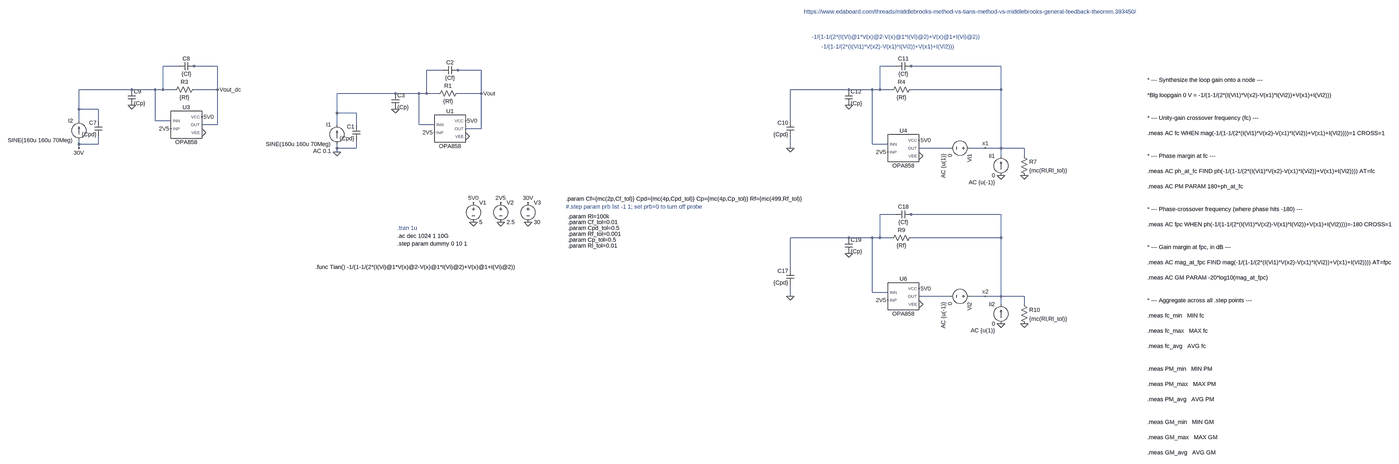
[diagram p0: schematic TIA.asc, whole sheet]
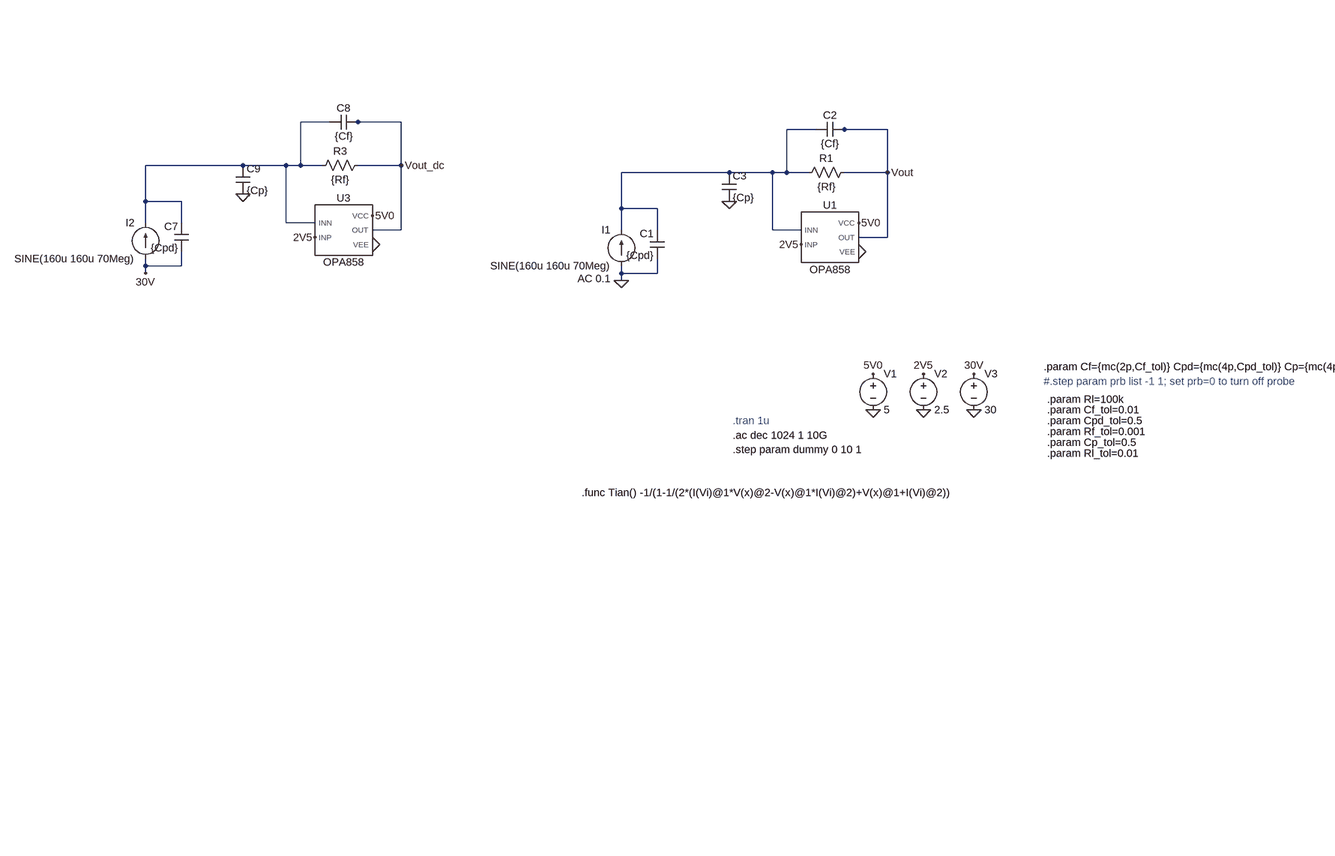
[diagram p1: schematic TIA.asc, part, row 1 of 1, column 1 of 2]
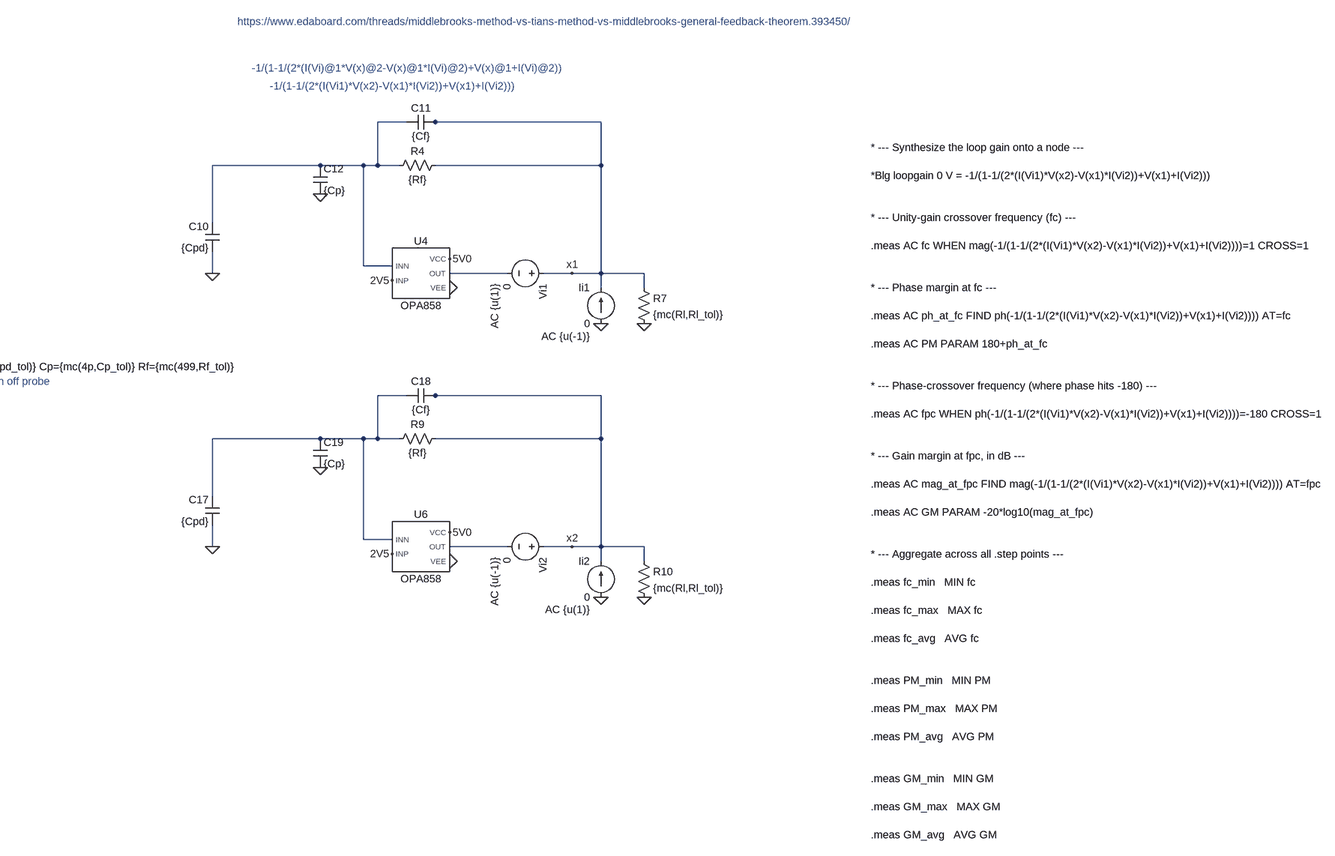
[diagram p2: schematic TIA.asc, part, row 1 of 1, column 2 of 2]
TIA.asc, the LTspice schematic file:
Version 4.1
SHEET 1 5184 1348
WIRE -848 -96 -912 -96
WIRE -784 -96 -800 -96
WIRE -688 -96 -784 -96
WIRE 2256 -96 2192 -96
WIRE 2320 -96 2304 -96
WIRE 2688 -96 2320 -96
WIRE 240 -80 176 -80
WIRE 304 -80 288 -80
WIRE 400 -80 304 -80
WIRE -1040 0 -1280 0
WIRE -944 0 -1040 0
WIRE -912 0 -912 -96
WIRE -912 0 -944 0
WIRE -864 0 -912 0
WIRE -688 0 -688 -96
WIRE -688 0 -784 0
WIRE 2064 0 1824 0
WIRE 2160 0 2064 0
WIRE 2192 0 2192 -96
WIRE 2192 0 2160 0
WIRE 2240 0 2192 0
WIRE 2688 0 2688 -96
WIRE 2688 0 2320 0
WIRE 48 16 -192 16
WIRE 144 16 48 16
WIRE 176 16 176 -80
WIRE 176 16 144 16
WIRE 224 16 176 16
WIRE 400 16 400 -80
WIRE 400 16 304 16
WIRE -1280 80 -1280 0
WIRE -1200 80 -1280 80
WIRE -192 96 -192 16
WIRE -112 96 -192 96
WIRE -1280 128 -1280 80
WIRE -1200 128 -1200 80
WIRE -944 128 -944 0
WIRE -880 128 -944 128
WIRE 1824 128 1824 0
WIRE -688 144 -688 0
WIRE -688 144 -752 144
WIRE -192 144 -192 96
WIRE -112 144 -112 96
WIRE 144 144 144 16
WIRE 208 144 144 144
WIRE 400 160 400 16
WIRE 400 160 336 160
WIRE -1280 224 -1280 208
WIRE -1200 224 -1200 192
WIRE -1200 224 -1280 224
WIRE 2160 224 2160 0
WIRE 2224 224 2160 224
WIRE -1280 240 -1280 224
WIRE -192 240 -192 224
WIRE -112 240 -112 208
WIRE -112 240 -192 240
WIRE 1824 240 1824 192
WIRE 2480 240 2352 240
WIRE 2624 240 2560 240
WIRE 2688 240 2688 0
WIRE 2688 240 2624 240
WIRE 2784 240 2688 240
WIRE -192 256 -192 240
WIRE 2688 272 2688 240
WIRE 2784 272 2784 240
WIRE 2256 512 2192 512
WIRE 2320 512 2304 512
WIRE 2688 512 2320 512
WIRE 2064 608 1824 608
WIRE 2160 608 2064 608
WIRE 2192 608 2192 512
WIRE 2192 608 2160 608
WIRE 2240 608 2192 608
WIRE 2688 608 2688 512
WIRE 2688 608 2320 608
WIRE 1824 736 1824 608
WIRE 2160 832 2160 608
WIRE 2224 832 2160 832
WIRE 1824 848 1824 800
WIRE 2480 848 2352 848
WIRE 2624 848 2560 848
WIRE 2688 848 2688 608
WIRE 2688 848 2624 848
WIRE 2784 848 2688 848
WIRE 2688 880 2688 848
WIRE 2784 880 2784 848
FLAG 368 544 0
FLAG 336 192 0
FLAG 336 128 5V0
FLAG 368 464 5V0
FLAG 480 544 0
FLAG 592 544 0
FLAG 400 16 Vout
FLAG 48 80 0
FLAG 208 176 2V5
FLAG 480 464 2V5
FLAG 592 464 30V
FLAG -752 176 0
FLAG -752 112 5V0
FLAG -688 0 Vout_dc
FLAG -1040 64 0
FLAG -880 160 2V5
FLAG -1280 240 30V
FLAG -192 256 0
FLAG 2352 272 0
FLAG 2352 208 5V0
FLAG 2064 64 0
FLAG 2224 256 2V5
FLAG 1824 240 0
FLAG 2624 240 x1
FLAG 2784 352 0
FLAG 2352 880 0
FLAG 2352 816 5V0
FLAG 2064 672 0
FLAG 2224 864 2V5
FLAG 1824 848 0
FLAG 2624 848 x2
FLAG 2784 960 0
FLAG 2688 352 0
FLAG 2688 960 0
SYMBOL OPA858 272 160 R0
SYMATTR InstName U1
SYMBOL voltage 368 448 R0
WINDOW 123 0 0 Left 0
WINDOW 39 0 0 Left 0
SYMATTR InstName V1
SYMATTR Value 5
SYMBOL voltage 480 448 R0
WINDOW 123 0 0 Left 0
WINDOW 39 0 0 Left 0
SYMATTR InstName V2
SYMATTR Value 2.5
SYMBOL voltage 592 448 R0
WINDOW 123 0 0 Left 0
WINDOW 39 0 0 Left 0
SYMATTR InstName V3
SYMATTR Value 30
SYMBOL res 320 0 R90
WINDOW 0 0 56 VBottom 2
WINDOW 3 32 56 VTop 2
SYMATTR InstName R1
SYMATTR Value {Rf}
SYMBOL current -192 224 R180
WINDOW 0 24 80 Left 2
WINDOW 3 24 0 Left 2
WINDOW 123 24 -28 Left 2
WINDOW 39 0 0 Left 0
SYMATTR InstName I1
SYMATTR Value SINE(160u 160u 70Meg)
SYMATTR Value2 AC 0.1
SYMBOL cap -96 208 R180
WINDOW 0 24 56 Left 2
WINDOW 3 24 8 Left 2
SYMATTR InstName C1
SYMATTR Value {Cpd}
SYMBOL cap 304 -96 R90
WINDOW 0 0 32 VBottom 2
WINDOW 3 32 32 VTop 2
SYMATTR InstName C2
SYMATTR Value {Cf}
SYMBOL cap 32 16 R0
SYMATTR InstName C3
SYMATTR Value {Cp}
SYMBOL OPA858 -816 144 R0
SYMATTR InstName U3
SYMBOL res -768 -16 R90
WINDOW 0 0 56 VBottom 2
WINDOW 3 32 56 VTop 2
SYMATTR InstName R3
SYMATTR Value {Rf}
SYMBOL current -1280 208 R180
WINDOW 0 24 80 Left 2
WINDOW 3 24 0 Left 2
WINDOW 123 24 -28 Left 2
WINDOW 39 0 0 Left 0
SYMATTR InstName I2
SYMATTR Value SINE(160u 160u 70Meg)
SYMBOL cap -1184 192 R180
WINDOW 0 24 56 Left 2
WINDOW 3 24 8 Left 2
SYMATTR InstName C7
SYMATTR Value {Cpd}
SYMBOL cap -784 -112 R90
WINDOW 0 0 32 VBottom 2
WINDOW 3 32 32 VTop 2
SYMATTR InstName C8
SYMATTR Value {Cf}
SYMBOL cap -1056 0 R0
SYMATTR InstName C9
SYMATTR Value {Cp}
SYMBOL OPA858 2288 240 R0
SYMATTR InstName U4
SYMBOL res 2336 -16 R90
WINDOW 0 0 56 VBottom 2
WINDOW 3 32 56 VTop 2
SYMATTR InstName R4
SYMATTR Value {Rf}
SYMBOL cap 1840 192 R180
WINDOW 0 24 56 Left 2
WINDOW 3 24 8 Left 2
SYMATTR InstName C10
SYMATTR Value {Cpd}
SYMBOL cap 2320 -112 R90
WINDOW 0 0 32 VBottom 2
WINDOW 3 32 32 VTop 2
SYMATTR InstName C11
SYMATTR Value {Cf}
SYMBOL cap 2048 0 R0
SYMATTR InstName C12
SYMATTR Value {Cp}
SYMBOL voltage 2576 240 R90
WINDOW 123 24 124 Left 2
WINDOW 39 0 0 Left 0
SYMATTR Value2 AC {u(1)}
SYMATTR InstName Vi1
SYMATTR Value 0
SYMBOL current 2688 352 R180
WINDOW 0 24 80 Left 2
WINDOW 3 24 0 Left 2
WINDOW 123 24 -28 Left 2
WINDOW 39 0 0 Left 0
SYMATTR InstName Ii1
SYMATTR Value 0
SYMATTR Value2 AC {u(-1)}
SYMBOL res 2768 256 R0
SYMATTR InstName R7
SYMATTR Value {mc(Rl,Rl_tol)}
SYMBOL OPA858 2288 848 R0
SYMATTR InstName U6
SYMBOL res 2336 592 R90
WINDOW 0 0 56 VBottom 2
WINDOW 3 32 56 VTop 2
SYMATTR InstName R9
SYMATTR Value {Rf}
SYMBOL cap 1840 800 R180
WINDOW 0 24 56 Left 2
WINDOW 3 24 8 Left 2
SYMATTR InstName C17
SYMATTR Value {Cpd}
SYMBOL cap 2320 496 R90
WINDOW 0 0 32 VBottom 2
WINDOW 3 32 32 VTop 2
SYMATTR InstName C18
SYMATTR Value {Cf}
SYMBOL cap 2048 608 R0
SYMATTR InstName C19
SYMATTR Value {Cp}
SYMBOL voltage 2576 848 R90
WINDOW 123 24 124 Left 2
WINDOW 39 0 0 Left 0
SYMATTR Value2 AC {u(-1)}
SYMATTR InstName Vi2
SYMATTR Value 0
SYMBOL current 2688 960 R180
WINDOW 0 24 80 Left 2
WINDOW 3 24 0 Left 2
WINDOW 123 24 -28 Left 2
WINDOW 39 0 0 Left 0
SYMATTR InstName Ii2
SYMATTR Value 0
SYMATTR Value2 AC {u(1)}
SYMBOL res 2768 864 R0
SYMATTR InstName R10
SYMATTR Value {mc(Rl,Rl_tol)}
TEXT 56 568 Left 2 ;.tran 1u
TEXT 56 600 Left 2 !.ac dec 1024 1 10G
TEXT 904 448 Left 2 !.param Cf={mc(2p,Cf_tol)} Cpd={mc(4p,Cpd_tol)} Cp={mc(4p,Cp_tol)} Rf={mc(499,Rf_tol)}
TEXT 904 480 Left 2 ;#.step param prb list -1 1; set prb=0 to turn off probe
TEXT -280 728 Left 2 !.func Tian() -1/(1-1/(2*(I(Vi)@1*V(x)@2-V(x)@1*I(Vi)@2)+V(x)@1+I(Vi)@2))
TEXT 1880 -320 Left 2 ;https://www.edaboard.com/threads/middlebrooks-method-vs-tians-method-vs-middlebrooks-general-feedback-theorem.393450/
TEXT 1912 -216 Left 2 ;-1/(1-1/(2*(I(Vi)@1*V(x)@2-V(x)@1*I(Vi)@2)+V(x)@1+I(Vi)@2))
TEXT 56 632 Left 2 !.step param dummy 0 10 1
TEXT 912 544 Left 2 !.param Cf_tol=0.01
TEXT 912 568 Left 2 !.param Cpd_tol=0.5
TEXT 912 592 Left 2 !.param Rf_tol=0.001
TEXT 912 616 Left 2 !.param Cp_tol=0.5
TEXT 912 520 Left 2 !.param Rl=100k
TEXT 912 640 Left 2 !.param Rl_tol=0.01
TEXT 1952 -176 Left 2 ;-1/(1-1/(2*(I(Vi1)*V(x2)-V(x1)*I(Vi2))+V(x1)+I(Vi2)))
TEXT 3288 -40 Left 2 !* --- Synthesize the loop gain onto a node ---\n \n*Blg loopgain 0 V = -1/(1-1/(2*(I(Vi1)*V(x2)-V(x1)*I(Vi2))+V(x1)+I(Vi2)))\n \n \n* --- Unity-gain crossover frequency (fc) ---\n \n.meas AC fc WHEN mag(-1/(1-1/(2*(I(Vi1)*V(x2)-V(x1)*I(Vi2))+V(x1)+I(Vi2))))=1 CROSS=1\n \n \n* --- Phase margin at fc ---\n \n.meas AC ph_at_fc FIND ph(-1/(1-1/(2*(I(Vi1)*V(x2)-V(x1)*I(Vi2))+V(x1)+I(Vi2)))) AT=fc\n \n.meas AC PM PARAM 180+ph_at_fc\n \n \n* --- Phase-crossover frequency (where phase hits -180) ---\n \n.meas AC fpc WHEN ph(-1/(1-1/(2*(I(Vi1)*V(x2)-V(x1)*I(Vi2))+V(x1)+I(Vi2))))=-180 CROSS=1\n \n \n* --- Gain margin at fpc, in dB ---\n \n.meas AC mag_at_fpc FIND mag(-1/(1-1/(2*(I(Vi1)*V(x2)-V(x1)*I(Vi2))+V(x1)+I(Vi2)))) AT=fpc\n \n.meas AC GM PARAM -20*log10(mag_at_fpc)\n \n \n* --- Aggregate across all .step points ---\n \n.meas fc_min   MIN fc\n \n.meas fc_max   MAX fc\n \n.meas fc_avg   AVG fc\n \n \n.meas PM_min   MIN PM\n \n.meas PM_max   MAX PM\n \n.meas PM_avg   AVG PM\n \n \n.meas GM_min   MIN GM\n \n.meas GM_max   MAX GM\n \n.meas GM_avg   AVG GM

The netlist it stands for:
* TIA.asc
X§U1 2V5 N003 5V0 0 Vout OPA858  ; pins INP INN VCC VEE OUT
V1 5V0 0 5
V2 2V5 0 2.5
V3 30V 0 30
R1 Vout N003 {Rf}
I1 0 N003 SINE(160u 160u 70Meg) AC 0.1
C1 0 N003 {Cpd}
C2 Vout N003 {Cf}
C3 N003 0 {Cp}
X§U3 2V5 N001 5V0 0 Vout_dc OPA858  ; pins INP INN VCC VEE OUT
R3 Vout_dc N001 {Rf}
I2 30V N001 SINE(160u 160u 70Meg)
C7 30V N001 {Cpd}
C8 Vout_dc N001 {Cf}
C9 N001 0 {Cp}
X§U4 2V5 N002 5V0 0 N004 OPA858  ; pins INP INN VCC VEE OUT
R4 x1 N002 {Rf}
C10 0 N002 {Cpd}
C11 x1 N002 {Cf}
C12 N002 0 {Cp}
Vi1 x1 N004 0 AC {u(1)}
Ii1 0 x1 0 AC {u(-1)}
R7 x1 0 {mc(Rl,Rl_tol)}
X§U6 2V5 N005 5V0 0 N006 OPA858  ; pins INP INN VCC VEE OUT
R9 x2 N005 {Rf}
C17 0 N005 {Cpd}
C18 x2 N005 {Cf}
C19 N005 0 {Cp}
Vi2 x2 N006 0 AC {u(-1)}
Ii2 0 x2 0 AC {u(1)}
R10 x2 0 {mc(Rl,Rl_tol)}
* .tran 1u
.ac dec 1024 1 10G
.param Cf={mc(2p,Cf_tol)} Cpd={mc(4p,Cpd_tol)} Cp={mc(4p,Cp_tol)} Rf={mc(499,Rf_tol)}
* #.step param prb list -1 1; set prb=0 to turn off probe
.func Tian() -1/(1-1/(2*(I(Vi)@1*V(x)@2-V(x)@1*I(Vi)@2)+V(x)@1+I(Vi)@2))
* https://www.edaboard.com/threads/middlebrooks-method-vs-tians-method-vs-middlebrooks-general-feedback-theorem.393450/
* -1/(1-1/(2*(I(Vi)@1*V(x)@2-V(x)@1*I(Vi)@2)+V(x)@1+I(Vi)@2))
.step param dummy 0 10 1
.param Cf_tol=0.01
.param Cpd_tol=0.5
.param Rf_tol=0.001
.param Cp_tol=0.5
.param Rl=100k
.param Rl_tol=0.01
* -1/(1-1/(2*(I(Vi1)*V(x2)-V(x1)*I(Vi2))+V(x1)+I(Vi2)))
* --- Synthesize the loop gain onto a node ---
*Blg loopgain 0 V = -1/(1-1/(2*(I(Vi1)*V(x2)-V(x1)*I(Vi2))+V(x1)+I(Vi2)))
* --- Unity-gain crossover frequency (fc) ---
.meas AC fc WHEN mag(-1/(1-1/(2*(I(Vi1)*V(x2)-V(x1)*I(Vi2))+V(x1)+I(Vi2))))=1 CROSS=1
* --- Phase margin at fc ---
.meas AC ph_at_fc FIND ph(-1/(1-1/(2*(I(Vi1)*V(x2)-V(x1)*I(Vi2))+V(x1)+I(Vi2)))) AT=fc
.meas AC PM PARAM 180+ph_at_fc
* --- Phase-crossover frequency (where phase hits -180) ---
.meas AC fpc WHEN ph(-1/(1-1/(2*(I(Vi1)*V(x2)-V(x1)*I(Vi2))+V(x1)+I(Vi2))))=-180 CROSS=1
* --- Gain margin at fpc, in dB ---
.meas AC mag_at_fpc FIND mag(-1/(1-1/(2*(I(Vi1)*V(x2)-V(x1)*I(Vi2))+V(x1)+I(Vi2)))) AT=fpc
.meas AC GM PARAM -20*log10(mag_at_fpc)
* --- Aggregate across all .step points ---
.meas fc_min   MIN fc
.meas fc_max   MAX fc
.meas fc_avg   AVG fc
.meas PM_min   MIN PM
.meas PM_max   MAX PM
.meas PM_avg   AVG PM
.meas GM_min   MIN GM
.meas GM_max   MAX GM
.meas GM_avg   AVG GM
.lib OPA858.lib
.backanno
.end